# Altium schematic sheet Analog Channels.schdoc
size 297 x 209 mm; Symbol: Drawing-Symbol_A4; @Project Name: Pedal Steel; @Page Count: 1; @Update Date: 2026-10-20; @Create Date: 2026-10-20; @Schematic Name: Schematic1; @Page No: 1; @Page Name: P1; Company: EasyEDA.com; Version: V1.0; Page Size: A4; Device: Drawing-Symbol_A4; @Create Time: 16:28:57; @Update Time: 16:28:57; Border: 1; Width: 1170; Height: 825; Region Start: 1; X Region Count: 6; Y Region Count: 4; Blade Width: 10; Title Block Position: 3
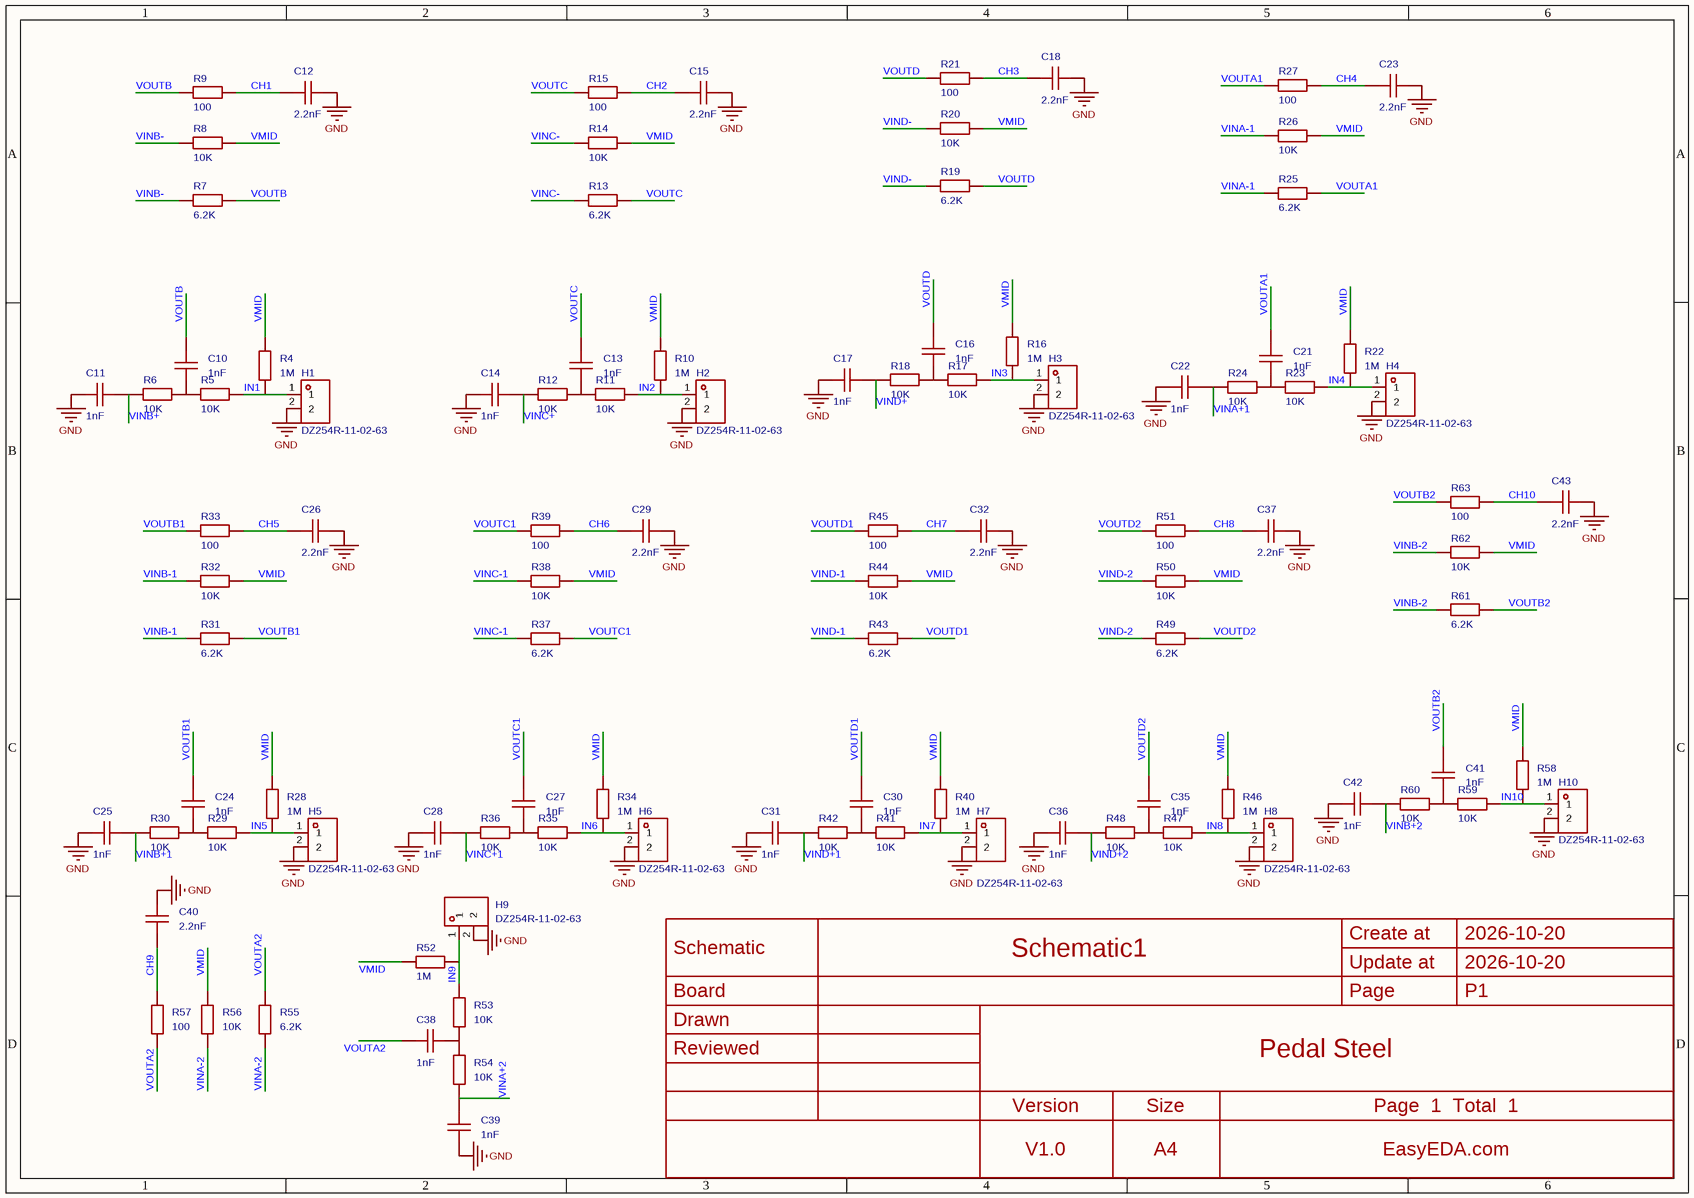
[diagram p0: Analog Channels.schdoc]

## Parts
C10  1nF  [C0603]
C11  1nF  [C0603]
C12  2.2nF  [C0603]
C13  1nF  [C0603]
C14  1nF  [C0603]
C15  2.2nF  [C0603]
C16  1nF  [C0603]
C17  1nF  [C0603]
C18  2.2nF  [C0603]
C21  1nF  [C0603]
C22  1nF  [C0603]
C23  2.2nF  [C0603]
C24  1nF  [C0603]
C25  1nF  [C0603]
C26  2.2nF  [C0603]
C27  1nF  [C0603]
C28  1nF  [C0603]
C29  2.2nF  [C0603]
C30  1nF  [C0603]
C31  1nF  [C0603]
C32  2.2nF  [C0603]
C35  1nF  [C0603]
C36  1nF  [C0603]
C37  2.2nF  [C0603]
C38  1nF  [C0603]
C39  1nF  [C0603]
C40  2.2nF  [C0603]
C41  1nF  [C0603]
C42  1nF  [C0603]
C43  2.2nF  [C0603]
H1  DZ254R-11-02-63  [HDR-TH_2P-P2.54-V-M-1]
H2  DZ254R-11-02-63  [HDR-TH_2P-P2.54-V-M-1]
H3  DZ254R-11-02-63  [HDR-TH_2P-P2.54-V-M-1]
H4  DZ254R-11-02-63  [HDR-TH_2P-P2.54-V-M-1]
H5  DZ254R-11-02-63  [HDR-TH_2P-P2.54-V-M-1]
H6  DZ254R-11-02-63  [HDR-TH_2P-P2.54-V-M-1]
H7  DZ254R-11-02-63  [HDR-TH_2P-P2.54-V-M-1]
H8  DZ254R-11-02-63  [HDR-TH_2P-P2.54-V-M-1]
H9  DZ254R-11-02-63  [HDR-TH_2P-P2.54-V-M-1]
H10  DZ254R-11-02-63  [HDR-TH_2P-P2.54-V-M-1]
R4  1M  [R0603]
R5  10K  [R0603]
R6  10K  [R0603]
R7  6.2K  [R0603]
R8  10K  [R0603]
R9  100  [R0603]
R10  1M  [R0603]
R11  10K  [R0603]
R12  10K  [R0603]
R13  6.2K  [R0603]
R14  10K  [R0603]
R15  100  [R0603]
R16  1M  [R0603]
R17  10K  [R0603]
R18  10K  [R0603]
R19  6.2K  [R0603]
R20  10K  [R0603]
R21  100  [R0603]
R22  1M  [R0603]
R23  10K  [R0603]
R24  10K  [R0603]
R25  6.2K  [R0603]
R26  10K  [R0603]
R27  100  [R0603]
R28  1M  [R0603]
R29  10K  [R0603]
R30  10K  [R0603]
R31  6.2K  [R0603]
R32  10K  [R0603]
R33  100  [R0603]
R34  1M  [R0603]
R35  10K  [R0603]
R36  10K  [R0603]
R37  6.2K  [R0603]
R38  10K  [R0603]
R39  100  [R0603]
R40  1M  [R0603]
R41  10K  [R0603]
R42  10K  [R0603]
R43  6.2K  [R0603]
R44  10K  [R0603]
R45  100  [R0603]
R46  1M  [R0603]
R47  10K  [R0603]
R48  10K  [R0603]
R49  6.2K  [R0603]
R50  10K  [R0603]
R51  100  [R0603]
R52  1M  [R0603]
R53  10K  [R0603]
R54  10K  [R0603]
R55  6.2K  [R0603]
R56  10K  [R0603]
R57  100  [R0603]
R58  1M  [R0603]
R59  10K  [R0603]
R60  10K  [R0603]
R61  6.2K  [R0603]
R62  10K  [R0603]
R63  100  [R0603]

## Nets
GND: C11.2 C12.1 C14.2 C15.1 C17.2 C18.1 C22.2 C23.1 C25.2 C26.1 C28.2 C29.1 C31.2 C32.1 C36.2 C37.1 C39.2 C40.1 C42.2 C43.1 H1.2 H2.2 H3.2 H4.2 H5.2 H6.2 H7.2 H8.2 H9.2 H10.2
CH1: C12.2 R9.2
CH2: C15.2 R15.2
CH3: C18.2 R21.2
CH4: C23.2 R27.2
CH5: C26.2 R33.2
CH6: C29.2 R39.2
CH7: C32.2 R45.2
CH8: C37.2 R51.2
CH9: C40.2 R57.2
CH10: C43.2 R63.2
IN1: H1.1 R4.1 R5.2
IN2: H2.1 R10.1 R11.2
IN3: H3.1 R16.1 R17.2
IN4: H4.1 R22.1 R23.2
IN5: H5.1 R28.1 R29.2
IN6: H6.1 R34.1 R35.2
IN7: H7.1 R40.1 R41.2
IN8: H8.1 R46.1 R47.2
IN9: H9.1 R52.1 R53.2
IN10: H10.1 R58.1 R59.2
VINA+1: C22.1 R24.1
VINA+2: C39.1 R54.1
VINA-1: R25.1 R26.1
VINA-2: R55.1 R56.1
VINB+: C11.1 R6.1
VINB+1: C25.1 R30.1
VINB+2: C42.1 R60.1
VINB-: R7.1 R8.1
VINB-1: R31.1 R32.1
VINB-2: R61.1 R62.1
VINC+: C14.1 R12.1
VINC+1: C28.1 R36.1
VINC-: R13.1 R14.1
VINC-1: R37.1 R38.1
VIND+: C17.1 R18.1
VIND+1: C31.1 R42.1
VIND+2: C36.1 R48.1
VIND-: R19.1 R20.1
VIND-1: R43.1 R44.1
VIND-2: R49.1 R50.1
VMID: R4.2 R8.2 R10.2 R14.2 R16.2 R20.2 R22.2 R26.2 R28.2 R32.2 R34.2 R38.2 R40.2 R44.2 R46.2 R50.2 R52.2 R56.2 R58.2 R62.2
VOUTA1: C21.1 R25.2 R27.1
VOUTA2: C38.1 R55.2 R57.1
VOUTB: C10.1 R7.2 R9.1
VOUTB1: C24.1 R31.2 R33.1
VOUTB2: C41.1 R61.2 R63.1
VOUTC: C13.1 R13.2 R15.1
VOUTC1: C27.1 R37.2 R39.1
VOUTD: C16.1 R19.2 R21.1
VOUTD1: C30.1 R43.2 R45.1
VOUTD2: C35.1 R49.2 R51.1
NetC10_2: C10.2 R5.1 R6.2
NetC13_2: C13.2 R11.1 R12.2
NetC16_2: C16.2 R17.1 R18.2
NetC21_2: C21.2 R23.1 R24.2
NetC24_2: C24.2 R29.1 R30.2
NetC27_2: C27.2 R35.1 R36.2
NetC30_2: C30.2 R41.1 R42.2
NetC35_2: C35.2 R47.1 R48.2
NetC38_2: C38.2 R53.1 R54.2
NetC41_2: C41.2 R59.1 R60.2

## Notes on the sheet
- Create at
- 2026-10-20
- Schematic
- Board
- Schematic1
- Update at
- Page
- P1
- Drawn
- Reviewed
- Pedal Steel
- Version
- V1.0
- Size
- A4
- Page  1  Total  1
- EasyEDA.com

## Library data of the parts
C10-C18 C21-C32 C35-C43 = CAP_0603: Symbol: CAP_OLD; ConvertToPcb: yes; ModelId: 624118aa3cc7497086c383c2d72e08520819f05c4eef4c71ace90d822a990e87; ModelName: C0603_L1.6-W0.8-H0.8; ModelTransform: 62.992,31.496,0,0,0,0,0,0,0; Device: CAP_0603; AddInBom: yes; Supplier Footprint: 0603; FootprintName: C0603
  C10 C11 C13 C14 C16 C17 C21 C22 C24 C25 C27 C28 C30 C31 C35 C36 C38 C39 C41 C42: Value: 1nF
  C12 C15 C18 C23 C26 C29 C32 C37 C40 C43: Value: 2.2nF
H1-H10 = DZ254R-11-02-63: Pin Structure:1x2P Pitch:2.54mm Row Spacing:- Circluar Pins/Square Pins:Pin Header Mounting Type:Through Hole Number of Rows:1 Number of Pins:2P Current Rating:3A Voltage Rating (Max):- Length of Mating Pin:6mm Insulation Height:2.54mm Length of End Conne; Manufacturer: DEALON(德艺隆); AddInBom: yes; ModelId: e506c2b6a89c4aacb020357246aab7250819f05c4eef4c71ace90d822a990e87; ModelName: HDR-M-2.54_1x2; ModelTransform: 200,100,0,0,0,0,0,0,-118.11; Pin Structure: 1x2P; Pitch: 2.54mm; Current Rating: 3A; Symbol: DZ254R-11-02-63; Device: DZ254R-11-02-63; LCSC Part Name: 1x2P 间距:2.54mm 方针 直插; SupplierPart: C2935908; ManufacturerPart: DZ254R-11-02-63; Supplier Footprint: 插件,P=2.54mm; JLCPCB Part Class: Extended Part; Datasheet: https://item.szlcsc.com/datasheet/DZ254R-11-02-63/3287486.html; Supplier: LCSC; ConvertToPcb: yes; FootprintName: HDR-TH_2P-P2.54-V-M-1; Row Spacing: -; Circluar Pins/Square Pins: Pin Header; Mounting Type: Through Hole; Number of Rows: 1; Number of Pins: 2P; Voltage Rating (Max): -; Length of Mating Pin: 6mm; Insulation Height: 2.54mm; Length of End Connection Pin: 3mm; Contact Material: Brass; Contact Plating: Gold; Operating Temperature: -; Color: Black
R4-R63 = Res_0603: Symbol: Res; ConvertToPcb: yes; ModelId: 112863783b5b41f1b5254f87eedc79320819f05c4eef4c71ace90d822a990e87; ModelTransform: 31.8897,63.7794,0,90,0,0,0,0,0; Device: Res_0603; AddInBom: yes; Supplier Footprint: 0603; FootprintName: R0603; ModelName: R0603
  R4 R10 R16 R22 R28 R34 R40 R46 R52 R58: Value: 1M
  R5 R6 R8 R11 R12 R14 R17 R18 R20 R23 R24 R26 R29 R30 R32 R35 R36 R38 R41 R42 R44 R47 R48 R50 R53 R54 R56 R59 R60 R62: Value: 10K
  R7 R13 R19 R25 R31 R37 R43 R49 R55 R61: Value: 6.2K
  R9 R15 R21 R27 R33 R39 R45 R51 R57 R63: Value: 100